# Altium schematic sheet 22_Magnetometro.SchDoc
size A4; SheetNumber: 4; SheetTotal: 16
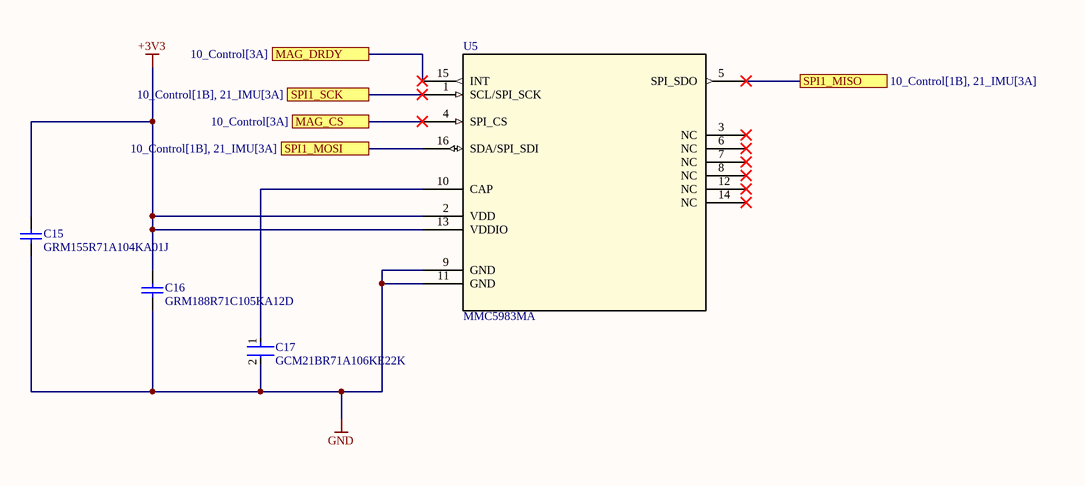
[diagram p0: 22_Magnetometro.SchDoc]

## Parts
C15  GRM155R71A104KA01J  [CAPC1005X55X25ML05T10]
C16  GRM188R71C105KA12D  [CAPC1608X90X35ML10T15]
C17  GCM21BR71A106KE22K  [FP-GCM21B-0_15-MFG]
U5  MMC5983MA  [MMC5983MA_MEM]

## Ports
MAG_CS (see 10_Control[3A]), MAG_DRDY (see 10_Control[3A]), SPI1_MISO (see 10_Control[1B], 21_IMU[3A]), SPI1_MOSI (see 10_Control[1B], 21_IMU[3A]), SPI1_SCK (see 10_Control[1B], 21_IMU[3A])

## Nets
+3V3: C15.2 C16.2 U5.2(VDD) U5.13(VDDIO)
GND: C15.1 C16.1 C17.2 U5.9(GND) U5.11(GND)
MAG_CS: U5.4(SPI_CS) ; port MAG_CS
MAG_DRDY: U5.15(INT) ; port MAG_DRDY
SPI1_MISO: U5.5(SPI_SDO) ; port SPI1_MISO
SPI1_MOSI: U5.16(SDA/SPI_SDI) ; port SPI1_MOSI
SPI1_SCK: U5.1(SCL/SPI_SCK) ; port SPI1_SCK
NetC17_1: C17.1 U5.10(CAP)

Not connected (* = marked no-connect by the designer): U5 3(NC)* 6(NC)* 7(NC)* 8(NC)* 12(NC)* 14(NC)*

## Library data of the parts
C15 = CMP-2008-04031-1: Manufacturer: Murata; Part Number: GRM155R71A104KA01J
C16 = CMP-2006-02845-1: Manufacturer: Murata; Part Number: GRM188R71C105KA12D
C17 = CMP-06035-062139-1: Ceramic Capacitor for Automotive 10uF ±10% 10VDC X7R 0805 Embossed T/R; Voltage Rating: 10V; Mount: Surface Mount; Max Operating Temperature: 125°C; Tolerance: 10%; Voltage Rating (DC): 10V; Dielectric: X7R; RoHS Compliant: Yes; Package Quantity: 10000; Min Operating Temperature: -55°C; Case/Package: 0805; Case Code (Imperial): 0805; Thickness: 0.055inch; Weight: 0.000335oz; Length: 0.079inch; Ratings: AEC-Q200; Case Code (Metric): 2012; Termination: SMD/SMT; Width: 1.25mm; Height: 1.25mm; Packaging: Tape and Reel; Capacitance: 10uF
U5 = MMC5983MA: Description; Manufacturer_Name: Memsic; Copyright: Copyright (C) 2025 Ultra Librarian. All rights reserved.; Manufacturer_Part_Number: MMC5983MA; RefDes: RefDes; Type: Type